# EasyEDA schematic 婴儿车.json
TITLE: Sheet_1; REV: 1.0; Date: 2024-04-20; Sheet: 1/1; Drawn By: ASDFGH48; Company: Your Company
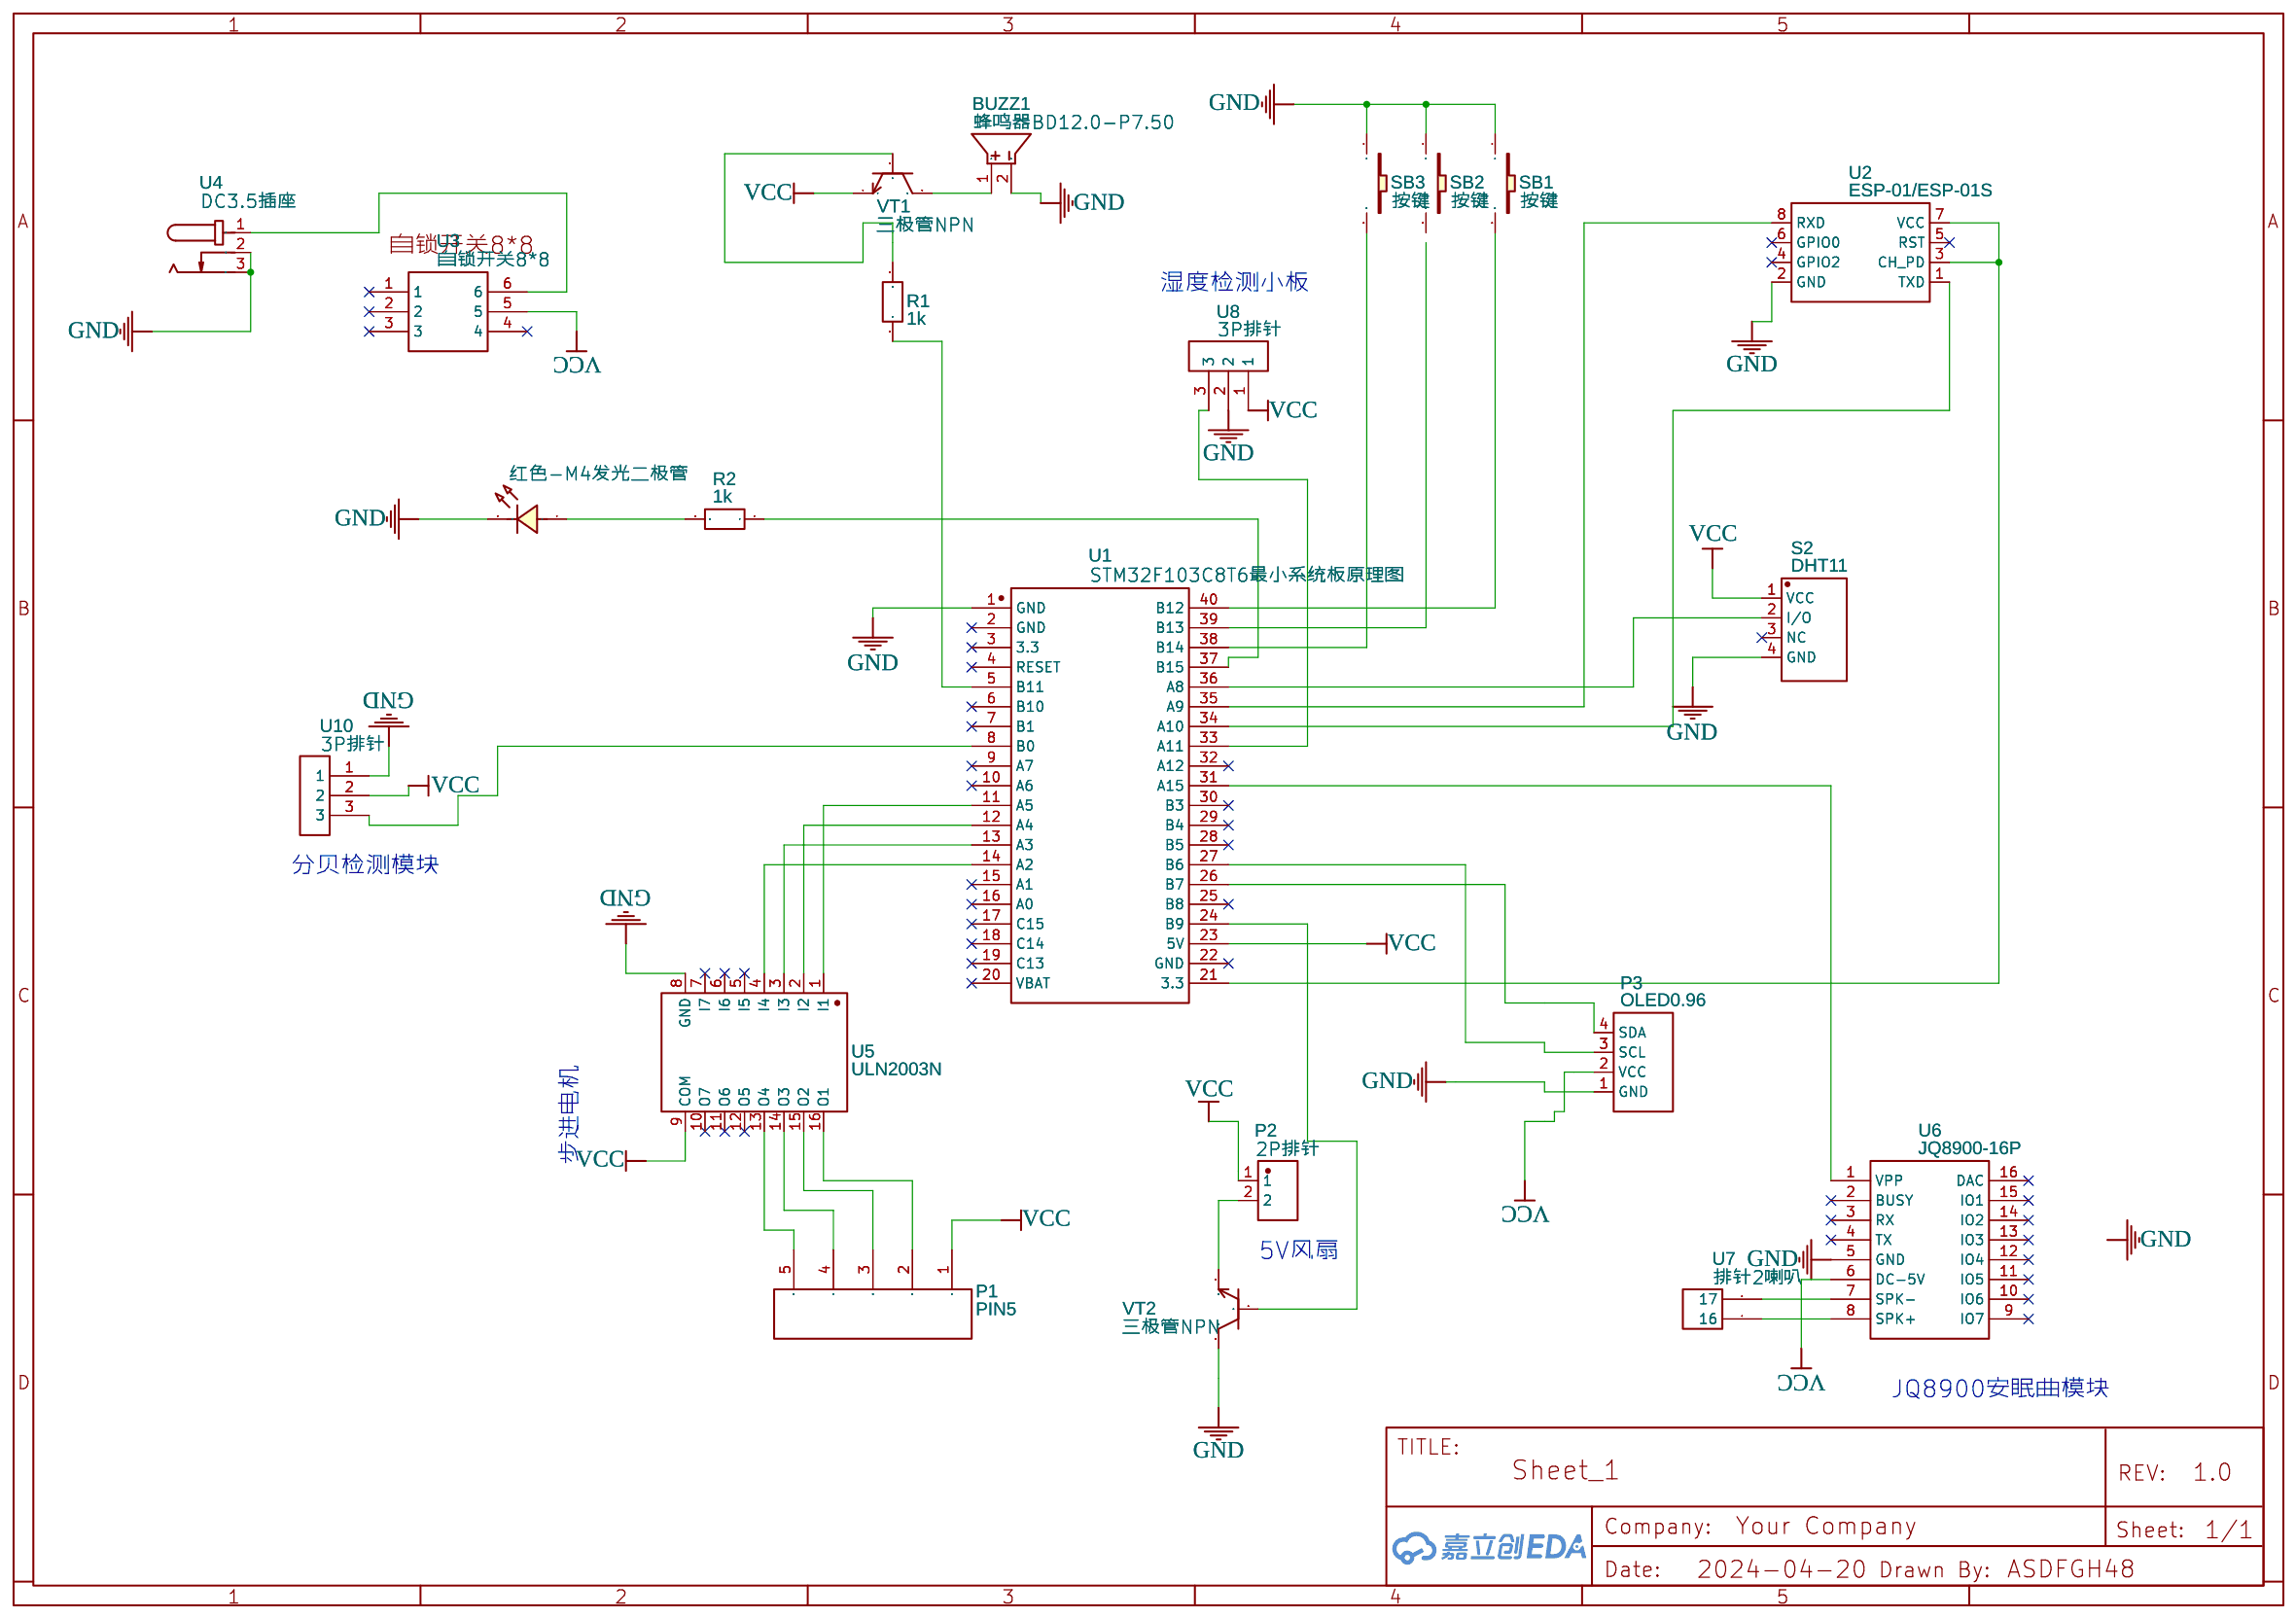
[diagram p0: schematic sheet]

## Parts
BUZZ1  蜂鸣器BD12.0-P7.50  [BUZ-TH_BD12.0-P7.50-D0.6-FD]
NO1  红色-M4发光二极管  [LED-TH_BD5.8-P2.50-R-RD_RED]
P1  PIN5  [PIN5]
P2  2P排针  [2P排针]
P3  OLED0.96  [0.96OLED_4P]
R1  1k  [SPARKFUN-RESISTORS_1/6W-RES]
R2  1k  [RESISTOR 1/4W SMALLER RESIZE]
S2  DHT11  [DHT11]
SB1  按键  [按键]
SB2  按键  [按键]
SB3  按键  [按键]
U1  STM32F103C8T6最小系统板原理图  [STM32F103C8T6最小系统板PCB图]
U2  ESP-01/ESP-01S  [WIFI模块8266]
U3  自锁开关8*8  [自锁开关8*8]
U4  DC3.5插座  [DC插座3.5MM]
U5  ULN2003N  [DIP-16_L19.8-W6.5-P2.54-LS7.6-BL]
U6  JQ8900-16P  [JQ8900-16P]
U7  排针2喇叭  [排针2P]
U8  3P排针  [3P排针]
U10  3P排针  [3P排针]
VT1  三极管NPN  [三极管NPN]
VT2  三极管NPN  [三极管NPN]

## Library data of the parts
BUZZ1 = 蜂鸣器BD12.0-P7.50: Supplier: LCSC; Supplier Part: C9900003117; Manufacturer: null; Contributor: LCSC; JLCPCB Part Class: Extended Part
NO1 = 红色-M4发光二极管: Supplier: LCSC; Supplier Part: C9900003231; Contributor: LCSC; JLCPCB Part Class: Extended Part
P1 = PIN5: Contributor: Alvin_li
P2 = 2P排针: Supplier: 安信可; Contributor: dhma
P3 = OLED0.96: Contributor: yuwenrong
R1 R2 = R_0603_EU: Contributor: LCEDA_Lib; Package Display: No
S2 = DHT11: Supplier Part: C87032; Supplier: LCSC; Manufacturer: AOSONG
SB1-SB3 = 按键: Contributor: garyqin
U1 = STM32F103C8T6最小系统板原理图: Supplier: LCSC; Contributor: shui
U2 = ESP-01/ESP-01S: Contributor: King3
U3 = 自锁开关8*8: Contributor: zry_972195923
U4 = DC3.5插座: Supplier: UPZZZSTUDIO; Contributor: locolyl
U5 = ULN2003N: Supplier: LCSC; Supplier Part: C383065; Manufacturer: HGSEMI; Contributor: LCSC; JLCPCB Part Class: Extended Part
U6 = JQ8900-16P: Contributor: LikeKind
U7 = 排针2: Contributor: 雏羽
U8 U10 = 3P排针: Contributor: 13006737074
VT1 VT2 = 三极管NPN: Contributor: WJCX

## Nets
GND: BUZZ1.2 NO1.2(K) P3.1(GND) S2.4(GND) SB1.1 SB2.1 SB3.1 U1.1(GND) U2.2(GND) U4.2 U4.3 U5.8(GND) U6.5(GND) U8.2 U10.1 VT2.3
VCC: P1.1 P2.1 P3.2(VCC) S2.1(VCC) U1.23(5V) U3.5 U5.9(COM) U6.6(DC-5V) U8.1 U10.2 VT1.1
Net-(BUZZ1-1): BUZZ1.1 VT1.3
Net-(NO1-1): NO1.1(A) R2.2
Net-(P1-2): P1.2 U5.16(O1)
Net-(P1-3): P1.3 U5.15(O2)
Net-(P1-4): P1.4 U5.14(O3)
Net-(P1-5): P1.5 U5.13(O4)
Net-(P2-2): P2.2 VT2.1
Net-(P3-3): P3.3(SCL) U1.27(B6)
Net-(P3-4): P3.4(SDA) U1.26(B7)
Net-(R1-1): R1.1 U1.5(B11)
Net-(R1-2): R1.2 VT1.2
Net-(R2-1): R2.1 U1.37(B15)
Net-(S2-2): S2.2(I/O) U1.36(A8)
Net-(SB1-2): SB1.2 U1.40(B12)
Net-(SB3-2): SB3.2 U1.38(B14)
Net-(U1-8): U1.8(B0) U10.3
Net-(U1-11): U1.11(A5) U5.1(I1)
Net-(U1-12): U1.12(A4) U5.2(I2)
Net-(U1-13): U1.13(A3) U5.3(I3)
Net-(U1-14): U1.14(A2) U5.4(I4)
Net-(U1-21): U1.21(3.3) U2.3(CH_PD) U2.7(VCC)
Net-(U1-24): U1.24(B9) VT2.2
Net-(U1-31): U1.31(A15) U6.1(VPP)
Net-(U1-33): U1.33(A11) U8.3
Net-(U1-34): U1.34(A10) U2.1(TXD)
Net-(U1-35): U1.35(A9) U2.8(RXD)
Net-(U3-6): U3.6 U4.1
Net-(U6-7): U6.7(SPK-) U7.2(17)
Net-(U6-8): U6.8(SPK+) U7.1(16)

Not connected (* = marked no-connect by the designer): S2 3(NC)*; SB2 2; U1 2(GND)* 3(3.3)* 4(RESET)* 6(B10)* 7(B1)* 9(A7)* 10(A6)* 15(A1)* 16(A0)* 17(C15)* 18(C14)* 19(C13)* 20(VBAT)* 22(GND)* 25(B8)* 28(B5)* 29(B4)* 30(B3)* 32(A12)* 39(B13); U2 4(GPIO2)* 5(RST)* 6(GPIO0)*; U3 1* 2* 3* 4*; U5 5(I5)* 6(I6)* 7(I7)* 10(O7)* 11(O6)* 12(O5)*; U6 2(BUSY)* 3(RX)* 4(TX)* 9(IO7)* 10(IO6)* 11(IO5)* 12(IO4)* 13(IO3)* 14(IO2)* 15(IO1)* 16(DAC)*

## Notes on the sheet
- 湿度检测小板
- 分贝检测模块
- 步进电机
- 5V风扇
- JQ8900安眠曲模块
